# EAGLE board powermodule_OLDBUCK (EAGLE 9.6.2)
PCB_VERSION: Powermodule V6.0
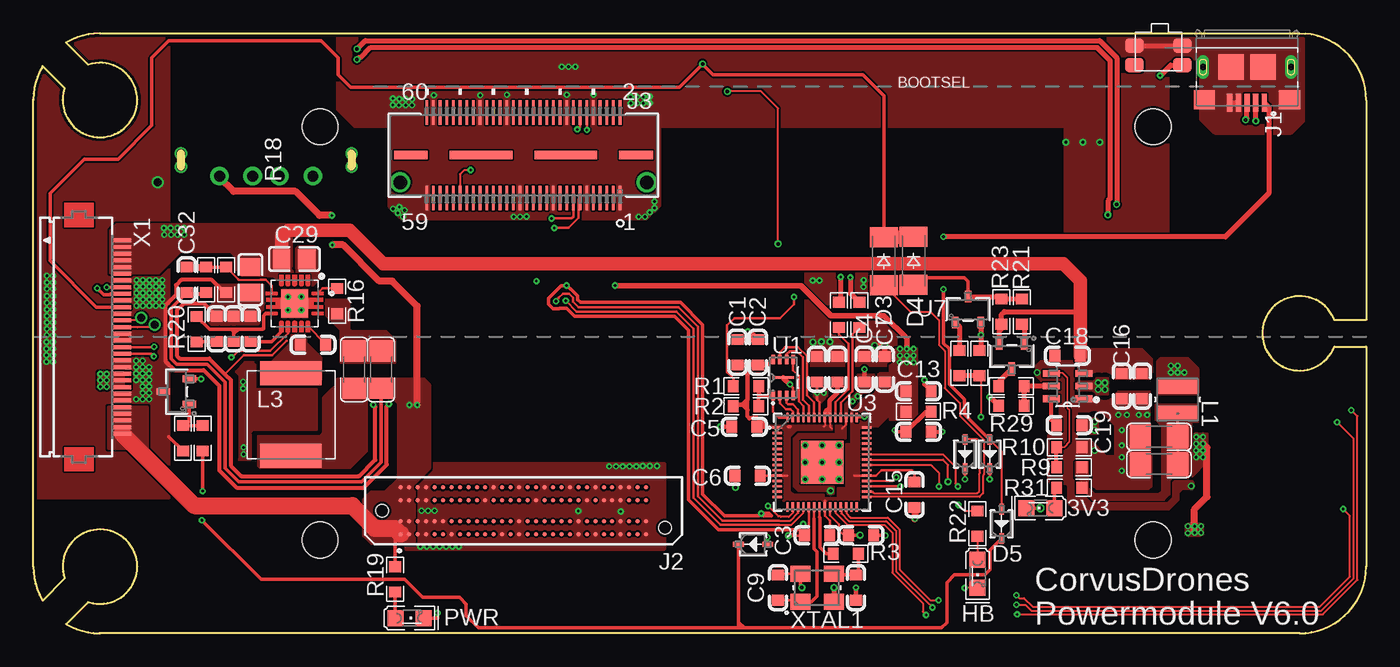
[diagram p9: board, top side]
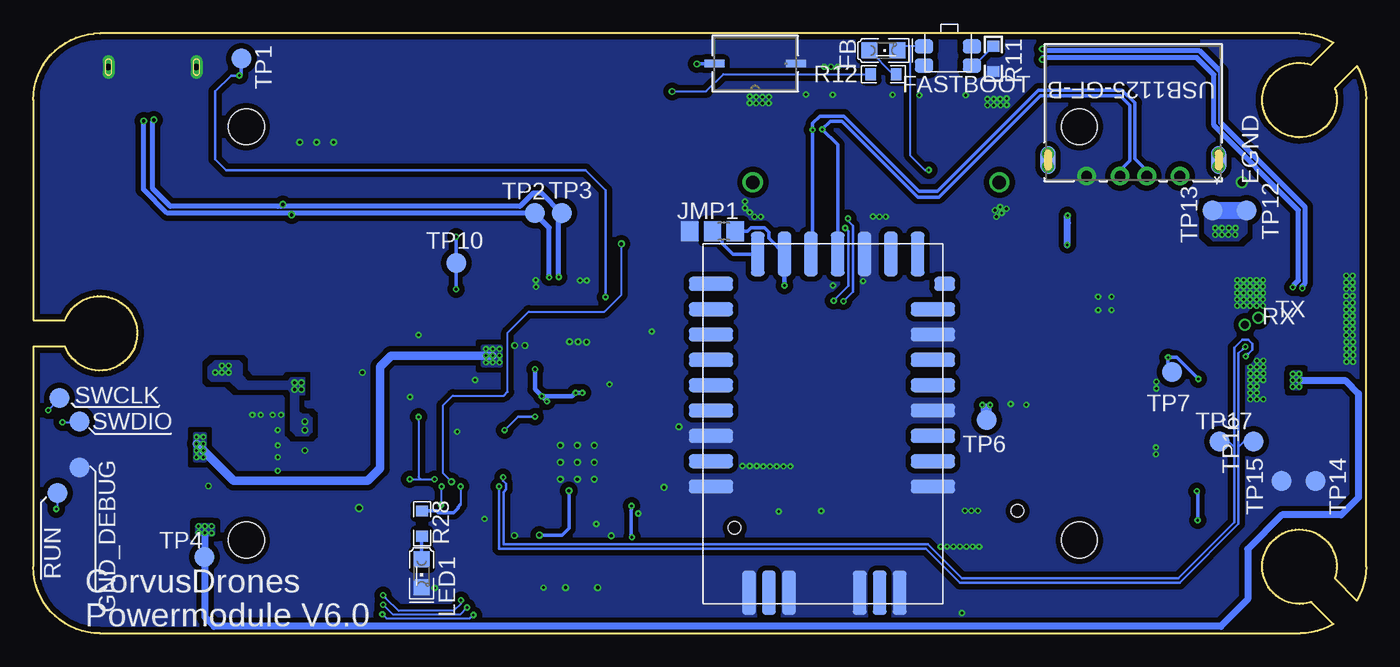
[diagram p10: board, bottom side, seen from below]

Size 100 x 45 mm. Coordinates in mm from the lower left corner, seen from the top.
Outline: 0.69,42.54 arc30 0,40.05 0,40 0,5 arc30 0.67,2.5 0.69,2.46 2.35,4.12 arc-120 5.56,7.74 5.8,7.68 arc-180 4.2,2.32 4.12,2.35 2.46,0.69 arc30 4.95,0 5,0 95,0 arc90 100,5 100,21.5 97.61,21.5 arc-135 92.45,21.36 92.36,21.59 arc-175 97.55,23.64 97.61,23.5 100,23.5 100,40 arc85 95.44,44.98 95,45 5,45 arc30 2.5,44.33 2.46,44.31 4.12,42.65 arc-125 7.68,39.2 7.6,38.97 arc-175 2.32,40.8 2.35,40.88 0.69,42.54
Copper layers (1*16): Top 0.035mm / dielectric 0.8mm / Bottom 0.035mm
Design rules "JLCPCB *": minimum track width 5mil, minimum drill 0.2mm, track to track 5mil, track to pad 0.2mm, pad to pad 5mil, via to via 10mil, smd to smd 5mil, copper to edge 0.2mm, drill to drill 10mil, minimum pad ring 0.13mm, minimum via ring 0.13mm, stop-mask expansion 0.05mm, vias tented up to drill 20mil, thermal gap 10mil
Holes 2.7 mm at 21.52,6.99 84.02,37.99 84.02,6.99 21.52,37.99

## Footprints (pad centres in the part's own frame; a part is rotated, then mirrored left to right if it is on the bottom)
CHIPLED_0805 = smd 1.2 x 1.2: A 0,-1.05; C 0,1.05
C0603 = smd 0.8 x 0.9: 1 -0.95,0; 2 0.95,0
C1206 = smd 1.6 x 1.8: 1 -1.4,0; 2 1.4,0
C0805 = smd 1.3 x 1.5: 1 -0.95,0; 2 0.95,0
SOD323_DIO-L = smd 0.806 x 0.35: 1 -1.099,0; 2 1.099,0
SOD-123_MINI-SMA = smd 1.5 x 2.1: A 1.8,0; C -1.8,0
TH-0.75/0.6 = drill 0.6 pad 0.75: P$2 0,0
TP15R = smd 1.5 x 1.5: TP 0,0
FCI_10118193-0001LF = smd 0.4 x 1.35: 1 -1.3,2.675; 2 -0.65,2.675; 3 0,2.675; 4 0.65,2.675; 5 1.3,2.675 | smd 1.6 x 1.4: S1 -3.2,2.45; S2 3.2,2.45 | smd 1.9 x 1.9: S3 1.2,0; S4 -1.2,0 | drill 0.5 pad 0.9 long: S5 -3.3,0; S6 3.3,0
SAMTEC_ADM6-30-01.5-L-4-2-A-TR = smd 0.356 x 0.356: A01 9.207,1.75; A02 8.572,1.75; A03 7.938,1.75; A04 7.303,1.75; A05 6.668,1.75; A06 6.032,1.75; A07 5.397,1.75; A08 4.763,1.75; A09 4.128,1.75; A10 3.493,1.75; A11 2.857,1.75; A12 2.223,1.75; A13 1.587,1.75; A14 0.953,1.75; A15 0.318,1.75; A16 -0.318,1.75; A17 -0.953,1.75; A18 -1.587,1.75; A19 -2.223,1.75; A20 -2.857,1.75; A21 -3.493,1.75; A22 -4.128,1.75; A23 -4.763,1.75; A24 -5.397,1.75; A25 -6.032,1.75; A26 -6.668,1.75; A27 -7.303,1.75; A28 -7.938,1.75; A29 -8.572,1.75; A30 -9.207,1.75; B01 9.207,0.79; B02 8.572,0.79; B03 7.938,0.79; B04 7.303,0.79; B05 6.668,0.79; B06 6.032,0.79; B07 5.397,0.79; B08 4.763,0.79; B09 4.128,0.79; B10 3.493,0.79; B11 2.857,0.79; B12 2.223,0.79; B13 1.587,0.79; B14 0.953,0.79; B15 0.318,0.79; B16 -0.318,0.79; B17 -0.953,0.79; B18 -1.587,0.79; B19 -2.223,0.79; B20 -2.857,0.79; B21 -3.493,0.79; B22 -4.128,0.79; B23 -4.763,0.79; B24 -5.397,0.79; B25 -6.032,0.79; B26 -6.668,0.79; B27 -7.303,0.79; B28 -7.938,0.79; B29 -8.572,0.79; B30 -9.207,0.79; C01 9.207,-0.79; C02 8.572,-0.79; C03 7.938,-0.79; C04 7.303,-0.79; C05 6.668,-0.79; C06 6.032,-0.79; C07 5.397,-0.79; C08 4.763,-0.79; C09 4.128,-0.79; C10 3.493,-0.79; C11 2.857,-0.79; C12 2.223,-0.79; C13 1.587,-0.79; C14 0.953,-0.79; C15 0.318,-0.79; C16 -0.318,-0.79; C17 -0.953,-0.79; C18 -1.587,-0.79; C19 -2.223,-0.79; C20 -2.857,-0.79; C21 -3.493,-0.79; C22 -4.128,-0.79; C23 -4.763,-0.79; C24 -5.397,-0.79; C25 -6.032,-0.79; C26 -6.668,-0.79; C27 -7.303,-0.79; C28 -7.938,-0.79; C29 -8.572,-0.79; C30 -9.207,-0.79; D01 9.207,-1.75; D02 8.572,-1.75; D03 7.938,-1.75; D04 7.303,-1.75; D05 6.668,-1.75; D06 6.032,-1.75; D07 5.397,-1.75; D08 4.763,-1.75; D09 4.128,-1.75; D10 3.493,-1.75; D11 2.857,-1.75; D12 2.223,-1.75; D13 1.587,-1.75; D14 0.953,-1.75; D15 0.318,-1.75; D16 -0.318,-1.75; D17 -0.953,-1.75; D18 -1.587,-1.75; D19 -2.223,-1.75; D20 -2.857,-1.75; D21 -3.493,-1.75; D22 -4.128,-1.75; D23 -4.763,-1.75; D24 -5.397,-1.75; D25 -6.032,-1.75; D26 -6.668,-1.75; D27 -7.303,-1.75; D28 -7.938,-1.75; D29 -8.572,-1.75; D30 -9.207,-1.75 | hole 0.95: 10.61,0; -10.61,1.27
CONN_QTH-030-02-L-D-A-K-FR_S00 = smd 0.203 x 1.829: 1 7.252,-3.2; 2 7.252,3.2; 3 6.752,-3.2; 4 6.752,3.2; 5 6.252,-3.2; 6 6.252,3.2; 7 5.751,-3.2; 8 5.751,3.2; 9 5.251,-3.2; 10 5.251,3.2; 11 4.751,-3.2; 12 4.751,3.2; 13 4.251,-3.2; 14 4.251,3.2; 15 3.751,-3.2; 16 3.751,3.2; 17 3.251,-3.2; 18 3.251,3.2; 19 2.751,-3.2; 20 2.751,3.2; 21 2.251,-3.2; 22 2.251,3.2; 23 1.75,-3.2; 24 1.75,3.2; 25 1.25,-3.2; 26 1.25,3.2; 27 0.75,-3.2; 28 0.75,3.2; 29 0.25,-3.2; 30 0.25,3.2; 31 -0.25,-3.2; 32 -0.25,3.2; 33 -0.75,-3.2; 34 -0.75,3.2; 35 -1.25,-3.2; 36 -1.25,3.2; 37 -1.75,-3.2; 38 -1.75,3.2; 39 -2.251,-3.2; 40 -2.251,3.2; 41 -2.751,-3.2; 42 -2.751,3.2; 43 -3.251,-3.2; 44 -3.251,3.2; 45 -3.751,-3.2; 46 -3.751,3.2; 47 -4.251,-3.2; 48 -4.251,3.2; 49 -4.751,-3.2; 50 -4.751,3.2; 51 -5.251,-3.2; 52 -5.251,3.2; 53 -5.751,-3.2; 54 -5.751,3.2; 55 -6.252,-3.2; 56 -6.252,3.2; 57 -6.752,-3.2; 58 -6.752,3.2; 59 -7.252,-3.2; 60 -7.252,3.2 | smd 4.699 x 0.635: 61 3.175,0; 62 -3.175,0 | smd 2.54 x 0.635: 63 8.445,0; 64 -8.445,0 | drill 1.016 pad 1.016: 66 9.246,-2.032; 67 -9.246,-2.032
CONN_USB1125-GF-B_GCT = drill 0.813 pad 1.397: 1 0,0; 2 2.489,0; 3 4.496,0; 4 7.01,0 | smd 1.118 x 2.108: 5 -2.9,-1.2; 6 9.9,-1.2 | drill 0.61 pad 0.61: S_1_H1 -2.896,-0.711; S_1_H2 -2.896,-1.702; S_2_H1 9.906,-0.711; S_2_H2 9.906,-1.702
A0R-JMP = smd 1.5 x 1.3: 1 0,1.7; 2 0,0; 3 0,-1.7
IND_VLS3012HBX-3R3M_TDK-L = smd 1.168 x 3.048: 1 -1.041,0; 2 1.041,0
IND_ECS-MPIL0630-3R3MC = smd 1.8 x 4.6: 1 -3.1,0; 2 3.1,0
R0603 = smd 0.8 x 0.9: 1 -0.95,0; 2 0.95,0
W25Q16JVUXIQ_WIN-L = smd 0.711 x 0.254: 1 -1.348,0.75; 2 -1.348,0.25; 3 -1.348,-0.25; 4 -1.348,-0.75; 5 1.348,-0.75; 6 1.348,-0.25; 7 1.348,0.25; 8 1.348,0.75 | smd 0.203 x 1.6: 9 0,0
RP2040TR7_RPI-L_CUSTM = smd 0.711 x 0.178: 1 -3.353,2.6; 2 -3.353,2.2; 3 -3.353,1.8; 4 -3.353,1.4; 5 -3.353,1; 6 -3.353,0.6; 7 -3.353,0.2; 8 -3.353,-0.2; 9 -3.353,-0.6; 10 -3.353,-1; 11 -3.353,-1.4; 12 -3.353,-1.8; 13 -3.353,-2.2; 14 -3.353,-2.6; 29 3.353,-2.6; 30 3.353,-2.2; 31 3.353,-1.8; 32 3.353,-1.4; 33 3.353,-1; 34 3.353,-0.6; 35 3.353,-0.2; 36 3.353,0.2; 37 3.353,0.6; 38 3.353,1; 39 3.353,1.4; 40 3.353,1.8; 41 3.353,2.2; 42 3.353,2.6 | smd 0.178 x 0.711: 15 -2.6,-3.353; 16 -2.2,-3.353; 17 -1.8,-3.353; 18 -1.4,-3.353; 19 -1,-3.353; 20 -0.6,-3.353; 21 -0.2,-3.353; 22 0.2,-3.353; 23 0.6,-3.353; 24 1,-3.353; 25 1.4,-3.353; 26 1.8,-3.353; 27 2.2,-3.353; 28 2.6,-3.353; 43 2.6,3.353; 44 2.2,3.353; 45 1.8,3.353; 46 1.4,3.353; 47 1,3.353; 48 0.6,3.353; 49 0.2,3.353; 50 -0.2,3.353; 51 -0.6,3.353; 52 -1,3.353; 53 -1.4,3.353; 54 -1.8,3.353; 55 -2.2,3.353; 56 -2.6,3.353 | smd 3.2 x 3.2: 57 0,0
DDC0006A_L = smd 1.27 x 0.508: 1 -1.219,0.95; 2 -1.219,0; 3 -1.219,-0.95; 4 1.219,-0.95; 5 1.219,0; 6 1.219,0.95
TO-236AB_NEX-L = smd 0.483 x 0.864: 1 -0.953,-0.978; 2 0.953,-0.978; 3 0,0.978
SW_PTS636_SK25J_SMTR_LFS_CNK-M = smd 1.499 x 0.559: 1 -3.057,0; 2 3.057,0
IC_TPS54821RHLR = smd 0.1 x 0.1: 1 -1.725,-0.75; 2 -1,-1.725; 3 -0.5,-1.725; 4 0,-1.725; 5 0.5,-1.725; 6 1,-1.725; 7 1.725,-0.75; 8 1.725,0.75; 9 1,1.725; 10 0.5,1.725; 11 0,1.725; 12 -0.5,1.725; 13 -1,1.725; 14 -1.725,0.75 | smd 2.05 x 2.05: 15 0,0 | drill 0.2 pad 0.4: 16 -0.5,0.5; 17 0.5,0.5; 18 -0.5,-0.5; 19 0.5,-0.5
TO-236_VIS-L = smd 0.508 x 1.016: 1 -0.95,-0.965; 2 0.95,-0.965; 3 0,0.965
WIFI-RTL8822BU = smd 3.302 x 1.016: BT-ANT 17.399,16.3; BT-DIS 17.399,12.5; BT-WAKE-HOST 17.399,3; HOST-WAKE-BT 17.399,6.8; HOST-WAKE-WL 17.399,4.9; ON-TXM 0.762,4.9; OPT-A 0.762,16.3; OPT-B 0.762,14.4; P$7 0.762,18.2; P$10 0.762,12.5; P$13 0.762,6.8; P$29 17.399,14.4; P$31 17.399,18.2; RSV 0.762,10.6; SUSCLK 17.399,8.7; WL-DIS 17.399,10.6; WL-WAKE-HOST 0.762,8.7 | smd 1.016 x 3.302: IN-RXM 1.9,0.762; IP-RXP 3.9,0.762; P$1 14.55,26.162; P$3 11.55,26.162; P$4 6.25,26.162; P$6 3.25,26.162; P$18 5.9,0.762; RST 13.9,0.762; USB-DM 9.9,0.762; USB-DP 7.9,0.762; VDD33 11.9,0.762; WL-ANT-A 4.75,26.162; WL-ANT-B 13.05,26.162 | smd 1.524 x 1.016: OP-TXP -0.127,3
EVQ-P7J01P = smd 1.4 x 1.05: 1 0,1.45; 2 3.6,1.45; 3 0,0; 4 3.6,0
FH12-30S-0.5SH = smd 0.3 x 1.3: 1 -7.25,3.25; 2 -6.75,3.25; 3 -6.25,3.25; 4 -5.75,3.25; 5 -5.25,3.25; 6 -4.75,3.25; 7 -4.25,3.25; 8 -3.75,3.25; 9 -3.25,3.25; 10 -2.75,3.25; 11 -2.25,3.25; 12 -1.75,3.25; 13 -1.25,3.25; 14 -0.75,3.25; 15 -0.25,3.25; 16 0.25,3.25; 17 0.75,3.25; 18 1.25,3.25; 19 1.75,3.25; 20 2.25,3.25; 21 2.75,3.25; 22 3.25,3.25; 23 3.75,3.25; 24 4.25,3.25; 25 4.75,3.25; 26 5.25,3.25; 27 5.75,3.25; 28 6.25,3.25; 29 6.75,3.25; 30 7.25,3.25
SMD3225_3.2X2.5X0.7_MTC-L = smd 1.194 x 1.499: 1 -1.054,1.257; 2 -1.054,-1.257; 3 1.054,-1.257; 4 1.054,1.257

## Placement (x,y rotation side)
3V3  [CHIPLED_0805]  75.56,9.4 90 top
C1  100nF  [C0603]  52.83,21.08 90 top
C2  2u2F  [C0603]  54.36,21.08 90 top
C3  100nF  [C0603]  58.8,7.37 0 top
C4  2u2F  [C0603]  62.36,19.81 270 top
C5  100nF  [C0603]  53.34,15.49 180 top
C6  100nF  [C0603]  53.59,11.81 180 top
C7  2u2F  [C0603]  63.88,19.81 270 top
C8  100nF  [C0603]  62.1,7.37 0 top
C9  10pF  [C0603]  55.88,3.43 270 top
C10  10pF  [C0603]  61.72,3.43 270 top
C11  2u2F  [C0603]  66.42,15.11 180 top
C12  100nF  [C0603]  60.33,19.81 90 top
C13  100nF  [C0603]  66.42,18.16 0 top
C14  100nF  [C0603]  58.8,19.81 270 top
C15  100nF  [C0603]  66.12,10.39 90 top
C16  10uF  [C0603]  81.66,18.54 270 top
C17  10uF  [C0603]  83.19,18.54 270 top
C18  100nF  [C0603]  77.6,20.83 180 top
C19  100nF  [C0603]  77.72,15.62 0 top
C20  22Uf  [C1206]  84.45,14.73 180 top
C21  22Uf  [C1206]  84.45,12.7 180 top
C28  4u7F  [C0805]  16.28,26.52 270 top
C29  2u2F  [C0805]  19.58,28.07 0 top
C30  22nF  [C0603]  16.31,22.83 270 top
C31  100nF  [C0603]  20.98,21.64 180 top
C32  ?  [C0603]  11.51,26.52 270 top
C33  33uF  [C1206]  24.05,19.79 90 top
C34  33uF  [C1206]  26.09,19.79 90 top
C35  22pF  [C0603]  15.04,22.83 270 top
C36  27nF  [C0603]  13.77,22.83 270 top
D1  1N4148WS-7-FSOD323_DIO-L  [SOD323_DIO-L]  69.9,13.44 90 top
D2  1N4148WS-7-FSOD323_DIO-L  [SOD323_DIO-L]  71.75,13.44 90 top
D3  CGRM4002-G  [SOD-123_MINI-SMA]  63.8,27.91 270 top
D4  CGRM4002-G  [SOD-123_MINI-SMA]  66.04,27.94 270 top
D5  1N4148WS-7-FSOD323_DIO-L  [SOD323_DIO-L]  72.64,8.2 90 top
D6  1N4148WS-7-FSOD323_DIO-L  [SOD323_DIO-L]  54,6.68 0 top
EGND  TH-0.75/0.6  [TH-0.75/0.6]  9.32,33.83 270 bottom
FB  [CHIPLED_0805]  36.22,43.71 270 bottom
GND_DEBUG  TPTP15R  [TP15R]  96.52,12.45 180 bottom
HB  [CHIPLED_0805]  70.84,4.47 180 top
J1  10118193-0001LF  [FCI_10118193-0001LF]  91.06,42.47 180 top
J2  ADM6-30-01.5-L-4-2-A-TR  [SAMTEC_ADM6-30-01.5-L-4-2-A-TR]  36.77,9.19 180 top
J3  QTH-030-01-L-D-ACONN_QTH-030-02-L-D-A-K-FR_S00  [CONN_QTH-030-02-L-D-A-K-FR_S00]  36.77,35.86 0 top
J4  USB1125-GF-B  [CONN_USB1125-GF-B_GCT]  13.97,34.29 180 bottom
JMP1  0R-JUMPA  [A0R-JMP]  49.05,30.15 270 bottom
L1  VLS3012HBX-3R3MIND_VLS3012HBX-3R3M_TDK-L  [IND_VLS3012HBX-3R3M_TDK-L]  85.85,17.53 90 top
L3  ECS-MPIL0630-3R3MC  [IND_ECS-MPIL0630-3R3MC]  19.33,16.41 270 top
LED1  [CHIPLED_0805]  70.87,4.5 180 bottom
PWR  [CHIPLED_0805]  28.22,1.14 270 top
R1  1K  [R0603]  53.47,18.54 0 top
R2  NO-FIT  [R0603]  53.47,17.02 180 top
R3  1K  [R0603]  60.96,5.97 0 top
R4  200  [R0603]  66.42,16.64 180 top
R5  27  [R0603]  61.98,23.88 90 top
R6  27  [R0603]  60.45,23.88 90 top
R8  10k  [R0603]  73.38,18.54 0 top
R9  33.2k  [R0603]  77.72,12.45 0 top
R10  10k  [R0603]  77.72,13.97 180 top
R11  1K  [R0603]  27.97,43.08 270 bottom
R12  220?  [R0603]  36.22,41.94 180 bottom
R16  100k  [R0603]  22.81,24.92 90 top
R17  10k  [R0603]  12.98,26.52 270 top
R18  1k37  [R0603]  14.45,26.52 90 top
R19  220?  [R0603]  27.15,4.04 90 top
R20  4.22k  [R0603]  12.27,22.81 90 top
R21  4k7  [R0603]  74.17,24.13 90 top
R22  220?  [R0603]  70.84,8.23 90 top
R23  100k  [R0603]  72.64,24.13 90 top
R24  4k7  [R0603]  69.49,20.27 270 top
R25  100k  [R0603]  70.97,20.27 90 top
R26  100k  [R0603]  11.23,14.63 90 top
R27  4k7  [R0603]  12.7,14.63 270 top
R28  220?  [R0603]  70.84,8.23 90 bottom
R29  100k  [R0603]  73.38,17.07 0 top
R31  220?  [R0603]  77.72,10.92 0 top
RX  TH-0.75/0.6  [TH-0.75/0.6]  9.09,23.14 0 bottom
SWCLK  TPTP15R  [TP15R]  98.04,17.65 180 bottom
SWDIO  TPTP15R  [TP15R]  96.52,15.88 180 bottom
TP1  TPTP15R  [TP15R]  84.4,43.1 270 bottom
TP2  TPTP15R  [TP15R]  62.38,31.52 0 bottom
TP3  TPTP15R  [TP15R]  60.35,31.52 0 bottom
TP4  TPTP15R  [TP15R]  87.17,5.71 0 bottom
TP6  TPTP15R  [TP15R]  28.47,16 0 bottom
TP7  TPTP15R  [TP15R]  14.55,19.58 0 bottom
TP10  TPTP15R  [TP15R]  68.28,27.76 0 bottom
TP11  TPTP15R  [TP15R]  98.17,10.54 90 bottom
TP12  TPTP15R  [TP15R]  8.99,31.7 90 bottom
TP13  TPTP15R  [TP15R]  11.53,31.7 90 bottom
TP14  TPTP15R  [TP15R]  3.81,11.43 270 bottom
TP15  TPTP15R  [TP15R]  6.35,11.43 270 bottom
TP16  TPTP15R  [TP15R]  8.46,14.4 0 bottom
TP17  TPTP15R  [TP15R]  11,14.38 0 bottom
TX  TH-0.75/0.6  [TH-0.75/0.6]  8.1,23.67 0 bottom
U1  W25Q16JVUXIQW25Q16JVUXIQ_WIN-L  [W25Q16JVUXIQ_WIN-L]  56.26,19.18 90 top
U3  RP2040TR7RP2040_SMALL_SILK  [RP2040TR7_RPI-L_CUSTM]  59.18,12.83 0 top
U4  TPS563201DDCRDDC0006A_L  [DDC0006A_L]  77.6,18.54 180 top
U7  2N7002,215TO-236AB_NEX-L  [TO-236AB_NEX-L]  70.13,24.28 0 top
U8  PTS636_SK25J  [SW_PTS636_SK25J_SMTR_LFS_CNK-M]  45.85,42.72 180 bottom
U10  TPS54821RHLR  [IC_TPS54821RHLR]  19.61,24.74 180 top
U11  SI2301CDS-T1-GE3TO-236_VIS-L  [TO-236_VIS-L]  73.41,20.8 180 top
U12  SI2301CDS-T1-GE3TO-236_VIS-L  [TO-236_VIS-L]  10.74,18.14 90 top
U$5  WIFI-RTL8822BU  [WIFI-RTL8822BU]  31.75,29.21 180 bottom
U$6  FASTBOOT  [EVQ-P7J01P]  33.17,42.57 0 bottom
U$7  BOOTSEL  [EVQ-P7J01P]  82.6,42.62 0 top
X1  FH12-30S-0.5SH  [FH12-30S-0.5SH]  3.43,22.23 270 top
XTAL1  MCSJK-7U  [SMD3225_3.2X2.5X0.7_MTC-L]  58.8,3.43 90 top

## Tracks (layer width: path | path; a pad name or v marks a point on that pad's centre or on a via)
+1V1  (via drill 0.2, 0.25)
  Top 0.178: U3.50 58.98,17.34 58.8,17.53 C14.2 | U3.45 60.98,15.64 60.71,15.37 | C8.1 60.82,7.37 60.44,7.75 60.44,8.19 59.78,8.85 U3.23
  Top 0.254: v62.03,7.37 C8.1
  Top 0.33: C4.2 v62.36,19.81
  Bottom 0.254: v62.03,7.37 60.33,7.37 59.82,7.87 v59.82,10.69
  Bottom 0.33: v62.36,19.81 62.36,18.29 v61.85,17.78 | v61.85,17.78 v61.47,17.4 | v61.85,17.78 59.56,17.78 v59.31,18.03 v58.8,18.03
  pour Top (no thermals): 61.85,19.43 61.85,18.16 60.83,17.14 60.83,16.13 61.09,16.13 61.09,16.89 62.23,18.03 62.74,18.03 63.12,18.41 63.12,19.43
  pour Top: 58.55,18.41 59.56,18.41 59.56,17.78 59.05,17.27 58.55,17.78
  pour Top: 60.2,15.62 60.96,15.62 60.96,14.61 57.53,14.61 57.4,14.48 57.4,11.18 57.53,11.05 60.07,11.05 60.07,10.41 59.56,10.41 59.56,10.67 57.4,10.67 57.02,11.05 57.02,14.61 57.4,14.99 60.2,14.99
+3V3  (via drill 0.2)
  Top 0.152: U3.49 59.38,15.57 59.31,15.49 | U3.48 59.78,15.48 59.89,15.37 | 54.61,15.47 55.79,15.47 U3.1
  Top 0.178: C3.2 59.75,8.45 59.38,8.82 U3.22 59.38,9.96 | 56.56,11.83 U3.10 54.56,11.83 C6.1 | U3.49 59.38,16.71 59.44,16.76 59.56,16.76 59.78,16.55 U3.48 | 54.31,15.47 C5.1 | 61.61,11.83 U3.33 63.21,11.83 63.63,12.24 65.91,12.24 66.12,12.04 C15.2 | C21.1 C20.1 L1.1 | 55.4,20.42 U1.8
  Top 0.254: 54.89,15.47 54.91,15.44 | 56.77,15.49 56.64,15.49 | 55.4,20.42 55.12,20.13 54.86,20.13
  Top 0.305: 53.59,16.76 53.59,16.26 53.72,16.13 54.36,16.13 55.02,15.47 54.89,15.47 54.61,15.47 54.31,15.47 | 53.59,16.76 53.59,17.53 | 53.21,17.14 53.59,16.76
  Top 0.33: C12.1 60.33,18.04 59.73,17.45 59.73,16.57 59.66,16.51 59.44,16.51 59.44,16.64 59.56,16.76 | R2.2 52.64,17.14 53.21,17.14 53.59,17.53 53.59,20.13
  Top 0.381: C1.1 53.59,20.13 C2.1 54.86,20.13
  Top 0.406: v43.64,26.09 57.58,26.09 59.84,23.82 63.83,23.82 65.53,22.12 v65.53,21.34
  Top 0.508: v87.12,7.54 87.12,9.3 88.06,10.24 88.06,13.92 v87.76,14.22
  Bottom 0.152: TP4.TP 87.12,5.77 v87.12,7.54
  Bottom 0.254: JMP1.1 46.42,30.15 46.15,30.43 45.16,30.43 44.81,30.09 44.81,29.61 U$5.VDD33
  Bottom 0.356: U$5.VDD33 v43.65,26.1 v43.64,26.09
  Bottom 0.508: v5.03,18.97 1.57,18.97 0.58,17.98 0.58,10.19 1.88,8.89 6.33,8.89 8.89,6.33 8.89,2.54 10.9,0.53 86.44,0.53 87.12,1.22 v87.12,7.54
  Bottom 0.635: v65.53,20.83 73.15,20.83 73.99,19.99 73.99,12.37 74.93,11.43 84.96,11.43 v87.76,14.22
  other vias: 87.25,13.21 87.25,13.72 87.25,14.22 87.25,14.73 87.76,14.73 87.76,13.72 87.76,13.21 66.04,21.34 66.04,20.83 66.04,20.32 65.53,20.32 65.02,20.32 65.02,20.83 65.02,21.34 5.03,19.46 5.51,18.97 5.51,19.46 5.03,18.49 5.51,18.49 86.61,7.52 86.61,8.03 87.12,8.03 87.6,8.03 87.6,7.54
  pour Top (no thermals): 63.37,19.43 63.37,18.29 62.87,17.78 62.48,17.78 61.34,16.64 61.34,15.49 63.37,15.49 64.26,16.38 64.26,18.03 64.39,18.16 64.39,19.43 64.26,19.56 63.5,19.56
  pour Top (no thermals): 64.26,16 64.26,20.07 64.52,20.32 64.52,21.08 64.77,21.34 66.29,21.34 66.29,16
  pour Top (rank 6, no thermals): 56.26,15.62 59.94,15.62 59.94,15.24 57.28,15.24 56.77,14.73 56.77,10.67 57.02,10.41 59.31,10.41 59.31,10.16 60.33,10.16 60.33,10.92 60.96,10.92 60.96,14.22 61.34,14.22 61.34,16.64 61.59,16.89 62.61,16.89 62.87,16.64 62.87,15.49 62.74,15.37 61.98,15.37 61.98,9.91 56.26,9.91
  pour Top (no thermals): 87.38,17.14 84.2,17.14 84.2,16 84.71,15.49 84.71,10.67 84.45,10.41 79.63,10.41 79.12,10.92 79.12,12.83 78.23,12.83 78.23,11.81 78.74,11.3 78.74,10.79 79.5,10.03 84.84,10.03 85.22,10.41 85.22,11.43 85.47,11.68 86.61,11.68 86.87,11.94 86.87,15.75 87,15.88 87.38,15.88
  pour Top (no thermals): 55.37,15.37 56.64,15.37 56.64,15.62 54.99,15.62 55.24,15.49
  pour Top: 85.09,11.68 86.87,11.68 88.11,12.93 88.11,14.99 87.12,14.99 87.12,13.59 87,13.46 85.09,13.46
  pour Bottom: 64.9,20.07 66.29,20.07 66.29,21.54 64.9,21.54
  pour Bottom: 87.12,12.95 87.88,12.95 87.88,14.99 87.12,14.99
  pour Top (rank 4, no thermals): 4.95,19.53 6.76,19.53 6.76,18.47 4.9,18.47 4.9,19.48
  pour Bottom: 5,19.46 5.49,19.46 5.49,18.49 5.03,18.49 5.03,19.41 4.98,19.46
  pour Top: 86.61,8.03 86.61,7.52 87.58,7.52 87.6,7.54 87.6,8.03
  pour Bottom: 86.61,8.03 86.61,7.49 87.58,7.49 87.6,7.52 87.6,8.03
+5V_USB  (via drill 0.2)
  Top 0.152: D2.2 72.64,13.65 D5.2
  Top 0.254: D2.2 69.85,16.44 69.85,17.55 68.72,18.68 68.72,21.33 68.28,21.77 v68.28,25.81
  Top 0.381: J1.1 92.71,39.44 92.71,33.02 89.43,29.74 v68.28,29.74
  Bottom 0.152: TP10.TP v68.28,25.81
  Bottom 0.254: v68.28,25.81 v68.28,29.74
+5V_VOXL  (via drill 0.2)
  Top 0.254: C34.1 26.09,12.83 24.61,11.35 15.42,11.35 14.38,12.39 14.38,18.82 13.03,20.17 10.77,20.17 10.34,20.6 10.34,24.4 11.38,25.45 | R19.2 27.15,7.03
  Top 0.305: C32.2 11.38,25.45 12.86,25.45 R17.2 | 27.15,7.03 J2.A01
  Top 0.508: v28.8,17.12 28.8,24.54 26.92,26.42 25.95,26.42 23.23,29.13 v22.43,29.13 | v22.4,31.34 21.46,31.34 19.67,33.14 15.02,33.14 13.97,34.18 J4.1
  Top 1.27: X1.30 12.08,9.58 23.92,9.58 25.62,7.88 27.12,7.88 J2.A01
  Bottom 0.152: 28.22,16.26 TP6.TP 28.8,16.33
  Bottom 0.254: v28.22,17.12 28.47,16.87 28.47,16.79 | 28.47,16.79 28.47,16.51 | 28.47,16.51 TP6.TP | v28.8,17.12 28.47,16.79 | v28.22,17.12 v28.8,17.12 | v28.8,17.12 28.8,16.33 | v28.22,17.12 28.22,16.26 | v28.8,17.12 28.8,16.84 28.47,16.51
  Bottom 0.508: v22.43,29.13 22.43,30.76 22.4,30.79 v22.4,31.34
  pour Top (no thermals): 25.04,19.05 23.11,19.05 21.79,17.73 21.69,17.63 21.69,15.01 21.46,14.78 16.84,14.78 16.84,12.57 16.99,12.42 23.8,12.42 24.97,13.59 25.04,13.67
  pour Top (rank 4, no thermals): 22.86,19.05 29.21,19.05 29.29,19.05 29.69,18.64 29.69,12.4 28.52,11.23 28.52,6.76 25.4,6.76 24.82,7.34 24.82,7.52 24.82,10.01 25.37,10.57 26.44,10.57 27.43,11.56 27.43,17.25 27.03,17.65 26.87,17.81 22.78,17.81 22.78,18.97
  pour Top (rank 5, no thermals): 5.69,16.94 8.51,16.94 8.51,13.89 5.69,13.89
+12V  (via drill 0.2)
  Top 0.381: U11.2 72.46,22.65 72.64,22.84 R23.1 72.64,23.93 72.85,24.13 78.18,24.13 78.61,23.7 78.61,20.89 C18.1
  Top 1.016: C29.1 18.63,29.71 19.15,30.23 23.72,30.23 26.24,27.71 68.58,27.71 77.27,27.71 78.55,26.43 C18.1
  Bottom 1.27: TP12.TP TP13.TP
  other vias: 9.8,30.4 10.31,30.4 10.82,30.4 11.33,30.4 11.33,29.9 10.82,29.9 10.34,29.9 9.83,29.9
  pour Top (isolate 0.508, no thermals): 83.19,21.34 78.36,21.34 78.36,19.18 79.38,19.18 79.63,19.43 80.9,19.43 80.9,19.18 81.03,19.05 83.82,19.05 83.95,19.18 83.95,20.57
  pour Top (rank 5, no thermals): 15.24,27.94 15.24,27.25 15.65,26.85 15.7,26.8 17.98,26.8 18.31,26.47 18.31,26.09 19.76,26.09 19.76,26.87 19.3,27.33 19.3,28.98 15.62,28.98 15.21,28.57 15.21,27.97
  pour Top (rank 4, no thermals): 5.82,30.2 5.82,27.03 9.4,27.03 11.02,28.65 14.81,28.65 15.93,27.53 19.33,27.53 19.33,30.25 18.95,30.63 6.25,30.63
  pour Bottom (rank 5, no thermals): 9.04,32.16 9.04,30.05 9.58,29.51 11.48,29.51 12.01,30.05 12.01,32.16
ADC_AVDD  (via drill 0.2)
  Top 0.152: 62.23,16.26 61.86,16.26 U3.43
  Top 0.178: 61.91,16.26 61.86,16.26
  Top 0.254: C11.2 64.77,15.11 v64.64,15.24 | v62.36,16.26 62.23,16.26 61.91,16.26
  Top 0.33: C11.2 67,16.64 R4.1
  Bottom 0.203: v62.36,16.26 63.63,16.26 v64.64,15.24
EN_3V3_BUCK
  Top 0.381: U11.3 72.43,18.86 R8.1
EN_VOXL_BUCK  (via drill 0.2)
  Top 0.203: U10.10 19.11,22.51 17.78,21.18 15.39,21.18 14.88,20.68 v14.86,20.7
  Top 0.254: U12.2 12.59,19.09 v12.6,19.07
  Bottom 0.254: v12.6,19.07 14.22,20.7 v14.86,20.7 14.86,19.89 TP7.TP
ESC_RX
  Top 0.152: X1.14 7.77,22.98 7.8,22.95 8.9,22.95 RX.P$2
ESC_TX
  Top 0.152: TX.P$2 7.91,23.48 X1.13
GND  (via drill 0.2, 0.25, 0.35)
  Top 0.152: HB.C 70.82,3.4 v69.88,3.4
  Top 0.178: v56.64,7.32 57.8,7.32 C3.1 58.18,7.7 U3.19 | C4.1 C7.1
  Top 0.203: v56.77,18.67 57.01,18.43 U1.4 | C9.1 55.98,4.48 XTAL1.4 | 14.36,19.44 15.77,20.85 17.92,20.85 19.02,21.95
  Top 0.254: v57.66,3.43 57.54,3.54 XTAL1.4 | 3V3.C v75.56,9.4 | C6.2 52.68,11.78 v52.68,10.95 | C8.2 63.08,7.34 v63.91,7.34 | v71.09,22.38 v71.08,22.39 U7.2 | v30.33,1.52 30.33,1.14 PWR.C | v56.64,7.32 56.87,7.32 v57.76,8.2 57.33,7.77 51.41,7.77 49.17,10.01 49.17,22.71 48.11,23.77 40.62,23.77 40.01,24.38 39.48,24.38 39.45,24.35 38.99,24.35 38.66,24.68 38.66,25.14 39.6,26.09 v40.01,26.09 40.26,25.83 40.32,25.83 40.84,25.31 40.84,25.02 41.05,24.82 48.54,24.82 50.22,23.14 50.22,10.44 51.85,8.81 54.43,8.81 v54.61,8.99 | v54.61,8.99 54.79,8.81 55.39,8.81 55.21,8.99 v54.61,8.99 | R26.1 10.16,14.75
  Top 0.305: C11.1 v68.2,15.11 | C13.2 66.85,18.68 v66.85,19 | R18.1 14.34,25.57 13.39,26.52 11.11,26.52 10.7,26.11 10.7,25.38 9.91,24.58 9.91,20.42 10.59,19.74 12.78,19.74 13.95,18.57 13.95,12.22 15.24,10.92 24.79,10.92 26.52,12.65 26.52,17.04 v26.67,17.2 | C36.1 12.84,24.71 11.26,24.71 10.77,24.22 10.77,20.83 11,20.6 13.21,20.6 14.36,19.44 14.81,19 14.81,12.57 15.6,11.79 24.43,11.79 25.65,13.01 25.65,16.99 v25.5,17.14
  Top 0.33: C5.2 v51.56,15.49 | C10.2 v61.72,3.43 | 60.06,3.42 v60.07,3.43
  Top 0.381: C7.1 v63.88,21.59 v63.12,21.59 | U7.2 71.08,21.33 R25.2 | U$7.1 U$7.2 | 92.26,43.01 J1.S4 | J1.5 J1.4 | v71.73,17.73 71.77,17.73 R29.1 | C1.2 C2.2 53.76,22.63 v53.59,22.63 | U1.9 v56.77,18.67 | v60.07,3.43 60.07,2.39 XTAL1.2
  Top 0.508: C15.1 66.14,9.41 v66.14,8.59
  other vias: 57.91,14.1 57.91,11.56 60.45,14.1 60.45,11.56 57.91,12.83 60.45,12.83 59.18,14.1 59.18,11.56 59.18,12.83 81.66,12.19 81.66,13.21 81.66,14.1 81.66,15.24 83.57,16.38 82.93,16.38 82.04,16.38 81.41,16.38 75.31,19.56 86.87,11.05 79.63,13.72 58.5,21.84 59.13,21.87 59.77,21.87 29.13,9.19 29.62,9.19 30.1,9.19 29.03,6.5 29.51,6.5 30,6.5 30.48,6.5 30.96,6.5 31.45,6.5 31.93,6.5 45.24,12.52 44.73,12.52 44.22,12.52 43.71,12.52 43.21,12.52 40.89,9.17 44.07,9.14 46.79,12.55 46.25,12.55 45.72,12.55 15.75,18.87 15.75,18.36 15.77,13.44 15.77,13.94 58.47,26.47 58.98,26.47 62.31,26.49 62.28,25.98 39.65,42.49 40.16,42.49 40.67,42.49 37.74,26.42 1.02,26.82 1.02,26.31 1.02,25.83 1.02,25.3 1.02,24.79 1.02,24.28 1.02,23.8 1.02,23.32 1.02,22.83 1.02,22.35 0.99,21.84 0.99,21.34 0.99,20.85 0.99,20.37 1.47,20.37 1.47,20.85 1.47,21.34 1.47,21.84 1.5,22.35 1.5,22.83 1.5,23.32 1.5,23.8 1.5,24.28 1.5,24.77 1.5,25.3 1.5,25.83 1.5,26.31 1.5,26.82 7.75,26.49 8.23,26.49 8.71,26.49 9.19,26.49 9.68,26.49 7.75,26.01 8.23,26.01 8.71,26.01 9.19,26.01 9.68,26.01 9.68,25.53 9.19,25.53 8.71,25.53 8.23,25.53 7.75,25.53 7.75,25.04 8.23,25.04 8.71,25.04 9.19,25.04 9.68,25.04 9.68,24.56 9.19,24.56 8.71,24.56 8.23,24.56 7.75,24.56 7.72,20.45 7.72,19.96 8.2,19.96 8.2,20.45 8.69,19.96 8.69,19.48 8.2,19.48 7.72,19.48 7.72,19 8.2,19 8.69,19 8.69,18.52 8.69,18.03 8.69,17.55 8.2,17.55 7.72,17.55 8.2,18.03 8.2,18.52 26.97,40.11 27.46,40.08 27.94,40.08 28.42,40.08 26.97,39.62 27.43,39.6 27.94,39.6 28.42,39.6 30.05,40.36 33.53,40.36 35.53,40.39 40.03,40.39 42.04,40.41 46.25,40.26 45.77,40.23 45.29,40.23 44.81,40.23 46.25,39.78 45.77,39.75 45.29,39.75 44.83,39.75 45.9,31.24 46.25,31.57 46.61,31.9 45.42,31.24 46.61,32.38 36.53,31.24 36.04,31.24 37.01,31.27 27.74,31.24 27.36,31.52 27,31.85 27.46,31.98 27.86,31.72 80.01,36.83 78.74,36.83 77.47,36.83
  pour Top (isolate 0.508, no thermals): 83.82,18.16 81.41,18.16 81.15,17.91 81.15,17.78 81.03,17.65 79.63,17.65 79.38,17.91 78.23,17.91 78.11,17.78 78.11,16.76 78.36,16.51 80.26,16.51 81.15,15.62 81.15,11.94 81.41,11.68 83.82,11.68
  pour Top (no thermals): 87,11.43 85.6,11.43 85.47,11.3 85.47,10.16 85.09,9.78 79.38,9.78 78.11,11.05 78.11,11.43 77.98,11.56 77.98,12.95 78.23,13.21 79.25,13.21 79.5,12.95 79.5,11.05 79.76,10.79 83.69,10.79 83.95,11.05 83.95,13.34 80.52,13.34 79.38,14.48 78.36,14.48 78.36,17.78 78.11,17.78 78.11,20.45 75.56,20.45 75.18,20.07 75.18,19.3 75.95,18.54 76.96,18.54 76.96,14.99 76.2,14.99 76.07,14.86 76.07,11.43 76.33,11.18 77.47,11.18 77.6,11.05 77.6,9.78 78.11,9.27 85.22,9.27 85.98,10.03 85.98,10.54 86.23,10.79 87,10.79 87.12,10.92 87.12,11.3
  pour Top (rank 6, no thermals): 58.04,20.19 64.64,20.19 64.64,27.74 58.04,27.74
  pour Bottom (isolate 0.406, rank 6, no thermals): -1.27,46.99 -1.27,-1.27 101.6,-1.27 101.6,46.99
  pour Top (rank 6, no thermals): 13.72,26.11 13.72,24.94 13.16,24.38 13.16,23.39 13.36,23.19 16.84,23.19 17.02,23.37 17.02,24.16 17.14,24.28 18.44,24.28 18.47,24.26 18.47,23.67 20.78,23.67 20.78,24.23 21.62,24.23 23.09,22.76 23.09,20.35 27.05,20.35 27.1,20.29 27.1,22 26.47,22.63 23.83,22.63 23.65,22.81 23.65,24.97 20.73,24.97 20.73,25.88 21.36,26.52 21.36,28.75 21.16,28.96 19.86,28.96 19.76,28.85 19.76,27.13 19.84,27.05 19.84,25.96 19.86,25.93 18.59,25.93 18.44,25.78 18.44,25.3 17.25,25.3 17.2,25.35 17.2,26.11
  pour Top (rank 6, no thermals): 27.94,12.7 27.94,6.35 47.35,6.35 47.35,12.7
  pour Top (rank 4): 16.51,20.32 15.85,20.32 15.16,19.63 15.47,19.33 15.47,18.69 15.47,13.11 15.39,13.03 16.26,13.03 16.31,13.08 16.31,14.88 16.28,14.91 16.28,15.04 16.36,15.11 16.51,15.27 21.26,15.27 21.26,18.31 16.71,18.31 16.66,18.26 16.66,20.14 16.51,20.29
  pour Top (rank 6, no thermals): -5.08,45.72 10.16,45.72 10.16,10.16 -5.08,10.16
  pour Top (rank 6, no thermals): 26.7,40.16 26.7,32.03 27.64,31.09 45.97,31.09 46.96,32.08 46.96,39.8 46.38,40.39 26.92,40.39
  pour Top (no thermals): 81.28,46.99 81.28,43.18 87.63,43.18 87.63,38.61 88.65,37.59 94.36,37.59 95.25,38.48 95.25,46.99
  pour Top (rank 5): 22.86,45.72 22.86,39.37 24.13,38.1 82.55,38.1 83.82,39.37 83.82,46.99
  pour Top (rank 4): 77.47,45.72 77.47,29.21 85.09,29.21 85.09,45.72
GPIO13  (via drill 0.2)
  Top 0.152: U3.16 56.98,9.04 56.68,8.74 56.08,8.74 56.06,8.76 55.91,8.76 v55.12,9.55
  Top 0.254: D6.2 v55.1,7.21 v55.09,7.21
  Bottom 0.254: v55.12,9.55 55.12,9.27 55.17,9.22 55.17,7.29 v55.09,7.21
GPIO18
  Top 0.152: D3.A 65.79,24.13 67.31,24.13 67.94,23.5 67.94,21.63 68.39,21.19 68.39,18.39 69.52,17.26 69.52,16.3 71.3,14.52 71.3,11.9 71.25,11.84 71.25,10.49 70.98,10.23 U3.29
GPIO19
  Top 0.152: D1.2 69.92,14.55 70.84,14.55 71.02,14.37 71.02,12.02 70.97,11.96 70.97,10.67 70.81,10.51 63.09,10.51 62.97,10.63 U3.30
GPIO23  (via drill 0.2)
  Top 0.152: U3.35 67.36,12.63 67.94,12.05 v67.94,11.01
  Bottom 0.152: v67.94,11.01 67.94,9.65 67.96,9.63
  Bottom 0.254: 67.96,9.63 68.12,9.47 68.12,9.39 68.45,9.06 69.64,9.06 69.76,9.18 R28.2
GPIO24  (via drill 0.25)
  Top 0.152: U3.36 68.25,13.03 68.58,12.7 | 68.58,12.7 68.66,12.62 | 68.58,12.7 68.58,11.42 v68.63,11.37 | v55.88,29.21 55.88,39.37 54.61,40.64 v52.07,40.64
  Bottom 0.152: v68.63,11.37 69.27,12.01 69.27,17.09 68.53,17.83 64.69,17.83 64.41,18.11 64.41,22.55 62.84,24.13 57.15,24.13 55.88,25.4 v55.88,29.21 | v52.07,40.64 49.53,40.64 48.23,41.94 R12.2
GPIO25  (via drill 0.2)
  Top 0.152: v69.37,11.01 69.16,11.22 69.16,12.51 68.25,13.43 U3.37 | v69.42,9.63 69.86,9.18 R22.2
  Bottom 0.152: v69.37,11.01 69.42,10.97 v69.42,9.63
N$1  (via drill 0.2)
  Top 0.203: R1.1 52.52,19.14 52.05,19.6 52.05,23.1 52.6,23.65 56.03,23.65 57.07,24.69 v57.07,25.22
  Top 0.381: v84.54,41.83 85.33,42.62 U$7.4
  Bottom 0.203: v84.54,41.83 85.17,41.83 86.36,40.64 86.36,35.56 85.55,34.75 58.57,34.75 57.07,33.25 v57.07,25.22
  Bottom 0.254: TP1.TP 84.4,41.83 v84.54,41.83
N$4
  Top 0.381: U4.5 R8.2 R29.2
N$5
  Top 0.127: R10.2 77.34,13.97 77.72,14.35 77.72,16.76 77.6,16.89 77.6,19.18 77.22,19.56 76.44,19.56 U4.4
  Top 0.3: R9.1 R10.2
N$6
  Top 0.3: C19.1 76.38,16.02 U4.6
N$7
  Bottom 0.152: R11.1 29.42,42.57 U$6.4
N$8  (via drill 0.2, 0.25)
  other vias: 86.36,19.56 85.85,19.56 85.85,20.07 85.34,20.07 85.34,19.56 79.88,18.29 79.88,18.8 80.39,18.8 80.39,18.29 79.63,15.24 79.63,15.88
  pour Top (isolate 0.254, no thermals): 80.64,17.91 79.76,17.91 79.5,18.16 78.36,18.16 78.36,18.92 79.5,18.92 79.76,19.18 80.64,19.18
  pour Bottom (no thermals): 80.64,17.91 79.63,17.91 79.63,19.18 80.64,19.18 80.9,18.92 83.95,18.92 84.33,19.3 84.33,20.19 84.58,20.45 86.36,20.45 86.87,19.94 86.87,19.18 86.61,18.92 85.22,18.92 84.58,18.29 80.9,18.29 80.64,18.03
  pour Bottom: 80.64,18.03 80.64,15.24 80.26,14.86 79.38,14.86 79.12,15.11 79.12,16.13 79.38,16.38 79.88,16.38 80.14,16.64 80.14,18.03
  pour Top (no thermals): 79.88,15.11 79.88,16 79.76,16.13 78.61,16.13 78.61,14.99 79.76,14.99
  pour Top (no thermals): 84.4,20.32 84.4,18.06 87.3,18.06 87.33,18.08 87.33,19.79 86.59,20.52 84.61,20.52
N$9  (via drill 0.2)
  Top 0.152: v32.82,34.75 32.33,34.75 32.02,34.44 J3.49
  Bottom 0.152: U$6.1 34.29,44.02 | 34.29,44.02 34.86,44.02 | 34.29,44.02 34.21,43.94 34.21,35.87 33.1,34.75 v32.82,34.75
  Bottom 0.305: 34.86,44.02 FB.C
N$10
  Top 0.203: 61.91,4.57 C10.1 | 60.16,4.38 XTAL1.3
  Top 0.254: R3.2 61.91,4.57 | C10.1 60.16,4.38
N$12
  Bottom 0.152: FB.A 35.49,41.94 R12.1
N$13
  Bottom 0.254: JMP1.2 48.32,29.43 48.32,29.26 47.51,28.45 U$5.RST
N$15
  Top 0.381: R21.1 74.36,22.99 U11.1
N$16
  Top 0.203: U10.1 21.71,25.87 R16.2
N$17
  pour Top (no thermals): 19.35,23.52 19.35,21.84 17.86,20.35 17.09,20.35 17.09,19.02 17.12,19 21.62,19 21.62,20.68 20.5,21.79 20.5,22.02 20.35,22.17 20.35,22.63 20.32,22.66 20.32,23.57 19.41,23.57
N$18
  Top 0.254: U10.9 18.61,22.62 17.87,21.89 C30.2
N$19
  Top 0.203: U10.13 21.93,21.69 C31.1
N$20
  Top 0.254: R19.1 27.15,1.16 PWR.A
N$21  (via drill 0.2)
  Top 0.254: D5.1 71.77,6.23 71.77,4.79 71.38,4.39 69.11,4.39 68.53,3.81 68.53,0.79 68.14,0.4 53.34,0.4 | 52.81,0.4 53.34,0.4 | D6.1 52.9,0.84 52.91,0.84 | 52.91,0.84 53.34,0.4 | 52.91,0.84 52.91,0.5 52.81,0.4 | 52.81,0.4 33.4,0.4 32.49,1.32 32.49,2.18 31.98,2.69 29.21,2.69 27.86,4.04 17.09,4.04 v12.65,8.48 | v12.7,10.67 R27.2
  Bottom 0.254: v12.65,8.48 12.65,10.62 v12.7,10.67
N$22
  Top 0.254: U10.8 17.44,23.99 17.27,23.82 17.27,22.86 17.22,22.81 15.39,22.81 | 15.39,22.81 15.04,22.45 | 15.04,22.45 C35.2 | R20.2 13.22,22.81 13.97,22.81 14.83,22.81 | 14.83,22.81 15.24,22.81 | 15.24,22.81 15.39,22.81 | 15.24,22.81 15.04,22.61 | 15.04,22.61 15.04,22.45 | 14.83,22.81 15.04,22.61
N$23
  Top 0.254: C36.2 12.29,21.89 R20.1
N$24
  Top 0.152: R22.1 HB.A
N$25
  Top 0.254: D4.A 66.57,26.67 69.85,26.67 70.13,26.39 U7.3
  Top 0.381: R21.2 R23.2 72.46,25.26 U7.3
N$26
  Top 0.254: R26.2 11.43,15.58 | 11.43,15.58 R27.1 | U12.1 11.71,15.86 11.43,15.58
N$27
  Top 0.381: U7.1 69.49,22.99 R24.1
N$28
  Bottom 0.254: R28.1 70.87,7.25 LED1.A
N$30  (via drill 0.2)
  Top 0.152: R25.1 71.09,19.19 v71.09,16.23
  Top 0.203: D1.1 v69.9,11.56 | v71.75,11.56 D2.1
  Top 0.381: R25.1 R24.2
  Bottom 0.152: v71.75,11.56 70.94,11.56 | 70.94,11.56 v69.9,11.56 | v71.09,16.23 71.09,11.71 70.94,11.56
N$32
  Top 0.254: 3V3.A 76.61,10.76 R31.1
QSPI_SD0
  Top 0.178: U1.5 57.01,19.74 57.43,19.32 57.43,17.4 57.78,17.04 U3.53
QSPI_SD1
  Top 0.178: U1.2 56.01,17.27 56.45,16.82 56.79,16.82 56.98,16.63 U3.55
QSPI_SD2
  Top 0.178: U3.54 57.38,16.79 56.98,17.18 56.64,17.18 56.51,17.31 U1.3
QSPI_SD3
  Top 0.178: U3.51 58.58,17.31 58.04,17.86 58.04,20.82 57.38,21.47 56.4,21.47 56.01,21.08 U1.7
QSPI_SLCK
  Top 0.178: U3.52 58.18,17.07 57.73,17.52 57.73,20.7 57.26,21.17 56.76,21.17 56.51,20.92 U1.6
QSPI_SS
  Top 0.178: U3.56 55.96,16.18 55.5,16.64 55.5,17.82 U1.1
  Top 0.254: R1.2 54.42,18.03 | 54.42,18.03 54.42,17.65 | 54.42,17.65 R2.1 | U1.1 54.62,17.83 | 54.62,17.83 54.42,18.03 | 54.62,17.83 54.59,17.83 54.42,17.65
RUN  (via drill 0.2)
  Top 0.152: U3.26 61.02,9.44 61.02,8.99 61.33,8.69 64.11,8.69 65,7.79 65,4.79 67.3,2.49 v67.92,2.49 | v73.76,2.86 73.97,2.65 74.33,2.65 75,1.98 96.52,1.98 98.78,4.25 98.78,8.81 v98.27,9.32
  Bottom 0.152: v67.92,2.49 67.92,2.21 68.45,1.68 72.58,1.68 73.55,2.65 v73.76,2.86 | v98.27,9.32 98.17,9.42 TP11.TP
SCL0  (via drill 0.2)
  Top 0.152: U3.32 64.46,11.43 v64.75,11.71
  Top 0.178: X1.18 8.84,20.98 v9.04,20.77
  Bottom 0.152: 9.91,13.97 10.31,14.38 TP17.TP
  Bottom 0.203: v64.75,11.71 64.75,11.45 64.53,11.23 64.53,10.79 64.73,10.59 64.73,6.68 32.88,6.68 30.34,4.14 14.11,4.14 9.91,8.34 9.91,13.97 9.91,21.4 9.29,22.02 8.85,22.02 8.54,21.71 8.54,21.27 8.85,20.95 8.86,20.95 v9.04,20.77
SCL_VOXL  (via drill 0.2)
  Top 0.152: U3.18 57.77,9.03 56.87,8.13 55.96,8.13
  Top 0.203: J3.13 40.92,32.56 40.92,31.18 40.17,30.43 39.11,30.43 v39.09,30.4 | v39.95,24.94 40.77,24.13 48.26,24.13 49.53,22.86 49.53,10.16 51.56,8.13 55.96,8.13
  Bottom 0.203: v39.09,30.4 38.84,30.16 38.84,26.06 v39.95,24.94
SDA0  (via drill 0.2)
  Top 0.178: U3.31 65.05,11.03 v65.06,11.01 | X1.17 9.05,21.48 v9.07,21.49
  Bottom 0.152: TP16.TP 9.14,14.4 9.58,13.97
  Bottom 0.203: v9.07,21.49 9.25,21.3 9.26,21.3 9.58,20.99 9.58,13.97 9.58,8.2 13.97,3.81 30.48,3.81 33.02,6.35 65.06,6.35 v65.06,11.01
SDA_VOXL  (via drill 0.2)
  Top 0.152: 55.93,8.46 56.81,8.46 57.38,9.03 U3.17
  Top 0.203: J3.15 40.52,31.25 40.39,31.11 v38.89,31.11 | v39.22,24.91 39.42,25.11 39.42,25.16 39.73,25.48 40.17,25.48 40.49,25.16 40.49,24.88 40.9,24.46 48.4,24.46 49.86,23 49.86,10.3 51.7,8.46 55.93,8.46
  Bottom 0.203: v38.89,31.11 38.89,30.96 38.51,30.58 38.51,25.62 v39.22,24.91
SW1  (via drill 0.25)
  Top 0.254: X1.11 4.74,24.48 1.27,27.94 1.27,33.02 3.81,35.56 6.35,35.56 8.89,38.1 8.89,43.18 10.16,44.45 21.59,44.45 22.86,43.18 22.86,41.91 23.8,40.97 48.49,40.97 v50.22,42.7 51,41.91 62.23,41.91 63.8,40.34 D3.C
  Top 1.016: D3.C 66.02,29.71 D4.C
  Bottom 0.254: U8.2 50.19,42.72 v50.22,42.7
SWCLK  (via drill 0.2)
  Top 0.152: U3.24 60.19,9.46 60.19,9.03 61.09,8.13 63.87,8.13 64.44,7.56 64.44,4.55 66.73,2.26 66.73,1.63 v66.98,1.37 | v73.81,1.42 96.75,1.42 99.34,4.01 99.34,16.28 v98.88,16.74
  Bottom 0.152: v66.98,1.37 67.23,1.12 73.51,1.12 v73.81,1.42 | v98.88,16.74 98.04,17.58 SWCLK.TP
SWDIO  (via drill 0.2)
  Top 0.152: U3.25 60.62,9.44 60.62,9 61.21,8.41 63.99,8.41 64.72,7.68 64.72,4.67 v67.45,1.94 | v73.76,2.14 74.44,2.14 74.88,1.7 96.63,1.7 99.06,4.13 99.06,14.61 97.84,15.82 v97.81,15.82
  Bottom 0.152: v67.45,1.94 67.99,1.4 73.02,1.4 v73.76,2.14 | v97.81,15.82 96.57,15.82 SWDIO.TP
USB-WIFI-DM  (via drill 0.2)
  Top 0.203: J3.12 41.53,39.05 v41.53,37.76
  Bottom 0.203: 41.53,28.56 U$5.USB-DM
  Bottom 0.254: 41.53,28.56 v41.53,37.76 41.53,38.25 41,38.79 39.18,38.79 33.54,33.15 32.18,33.15 24.59,40.74 18.31,40.74 17.35,39.78 17.35,35.59 16.46,34.7 J4.2
USB-WIFI-DP  (via drill 0.2)
  Top 0.203: v40.82,37.8 40.99,37.97 41,37.97 41.02,38 J3.14
  Bottom 0.254: U$5.USB-DP 39.65,36.63 v40.82,37.8 40.21,38.41 39.33,38.41 33.65,32.72 32.07,32.72 24.45,40.33 18.44,40.33 17.73,39.62 17.73,35.43 18.47,34.7 J4.3
USB_DM
  Top 0.178: 60.58,17.28 U3.46 | 61.46,18.15 61.47,18.16 61.47,22.42 R5.1
  Top 0.203: 60.58,17.28 61.46,18.15
USB_DP
  Top 0.178: U3.47 60.18,17.34 | 61.13,18.29 61.16,18.32 61.16,21.72 60.45,22.43 R6.1
  Top 0.203: 60.18,17.34 61.13,18.29
USBM_DM  (via drill 0.2, 0.25)
  Top 0.254: X1.8 5.53,25.98 v5.51,25.96
  Top 0.381: v61.3,26.7 61.3,25.51 R5.2 | v91.72,38.43 91.71,38.44 J1.2 | v24.28,43.04 24.42,43.18 24.55,43.18 25.31,43.94 79.8,43.94 80.77,42.97 80.77,32.58 80.63,32.44 80.63,31.39 v80.62,31.38
  Bottom 0.381: v61.3,26.7 61.3,30.43 TP2.TP 80.76,31.52 | v91.72,38.43 91.72,33.3 89.94,31.52 80.9,31.52 80.76,31.52 | v5.51,25.96 5.42,26.05 5.42,26.14 5.08,26.48 5.08,31.75 11.43,38.1 11.43,41.91 12.7,43.18 24.28,43.18 v24.28,43.04 | v80.62,31.38 80.76,31.52
USBM_DP  (via drill 0.2, 0.25)
  Top 0.254: X1.9 5.82,25.48 5.74,25.4 5.28,25.4 v4.79,25.88
  Top 0.381: R6.2 60.58,24.95 v60.58,26.72 | v90.95,38.51 91.06,38.61 J1.3 | v24.28,43.83 24.91,44.45 80.01,44.45 81.28,43.18 v81.28,32.17
  Bottom 0.254: TP3.TP 60.54,31.33
  Bottom 0.381: v60.58,26.72 60.58,31.29 60.54,31.33 | TP3.TP 61.85,33.02 62.5,33.02 63.49,32.03 81.42,32.03 | v90.95,38.51 91.04,38.41 91.04,33.34 89.73,32.03 81.66,32.03 81.42,32.03 | v4.79,25.88 4.79,26.04 4.57,26.27 4.57,31.96 10.92,38.31 10.92,42.12 12.49,43.69 24.14,43.69 v24.28,43.83 | v81.28,32.17 81.42,32.03
VSENSE
  Top 0.152: 15.4,26.52 17.07,26.52
  Top 0.203: R18.2 15.38,26.54 15.4,26.52 | 17.07,26.52 17.45,26.52 17.88,26.08 U10.7
  Top 0.254: R18.2 R17.1
  Top 0.508: C32.1 R17.1
XIN
  Top 0.178: 58.8,2.79 58.8,2.85 | 58.58,8.6 U3.20
  Top 0.203: C9.2 57.24,2.48 57.44,2.27
  Top 0.254: 57.44,2.27 XTAL1.1 58.38,2.38 58.8,2.79 | 58.58,8.6 58.58,6.35 58.8,6.13 58.8,2.85
XOUT
  Top 0.178: 58.98,8.71 U3.21
  Top 0.254: R3.1 59.5,5.97 59.02,6.45 59.02,8.67 58.98,8.71

## Text on the board
tNames: BOOTSEL | CorvusDrones
bNames: RUN | CorvusDrones